# Altium schematic sheet HUB75Ports.SchDoc
size A3; SheetNumber: 5; SheetTotal: 5
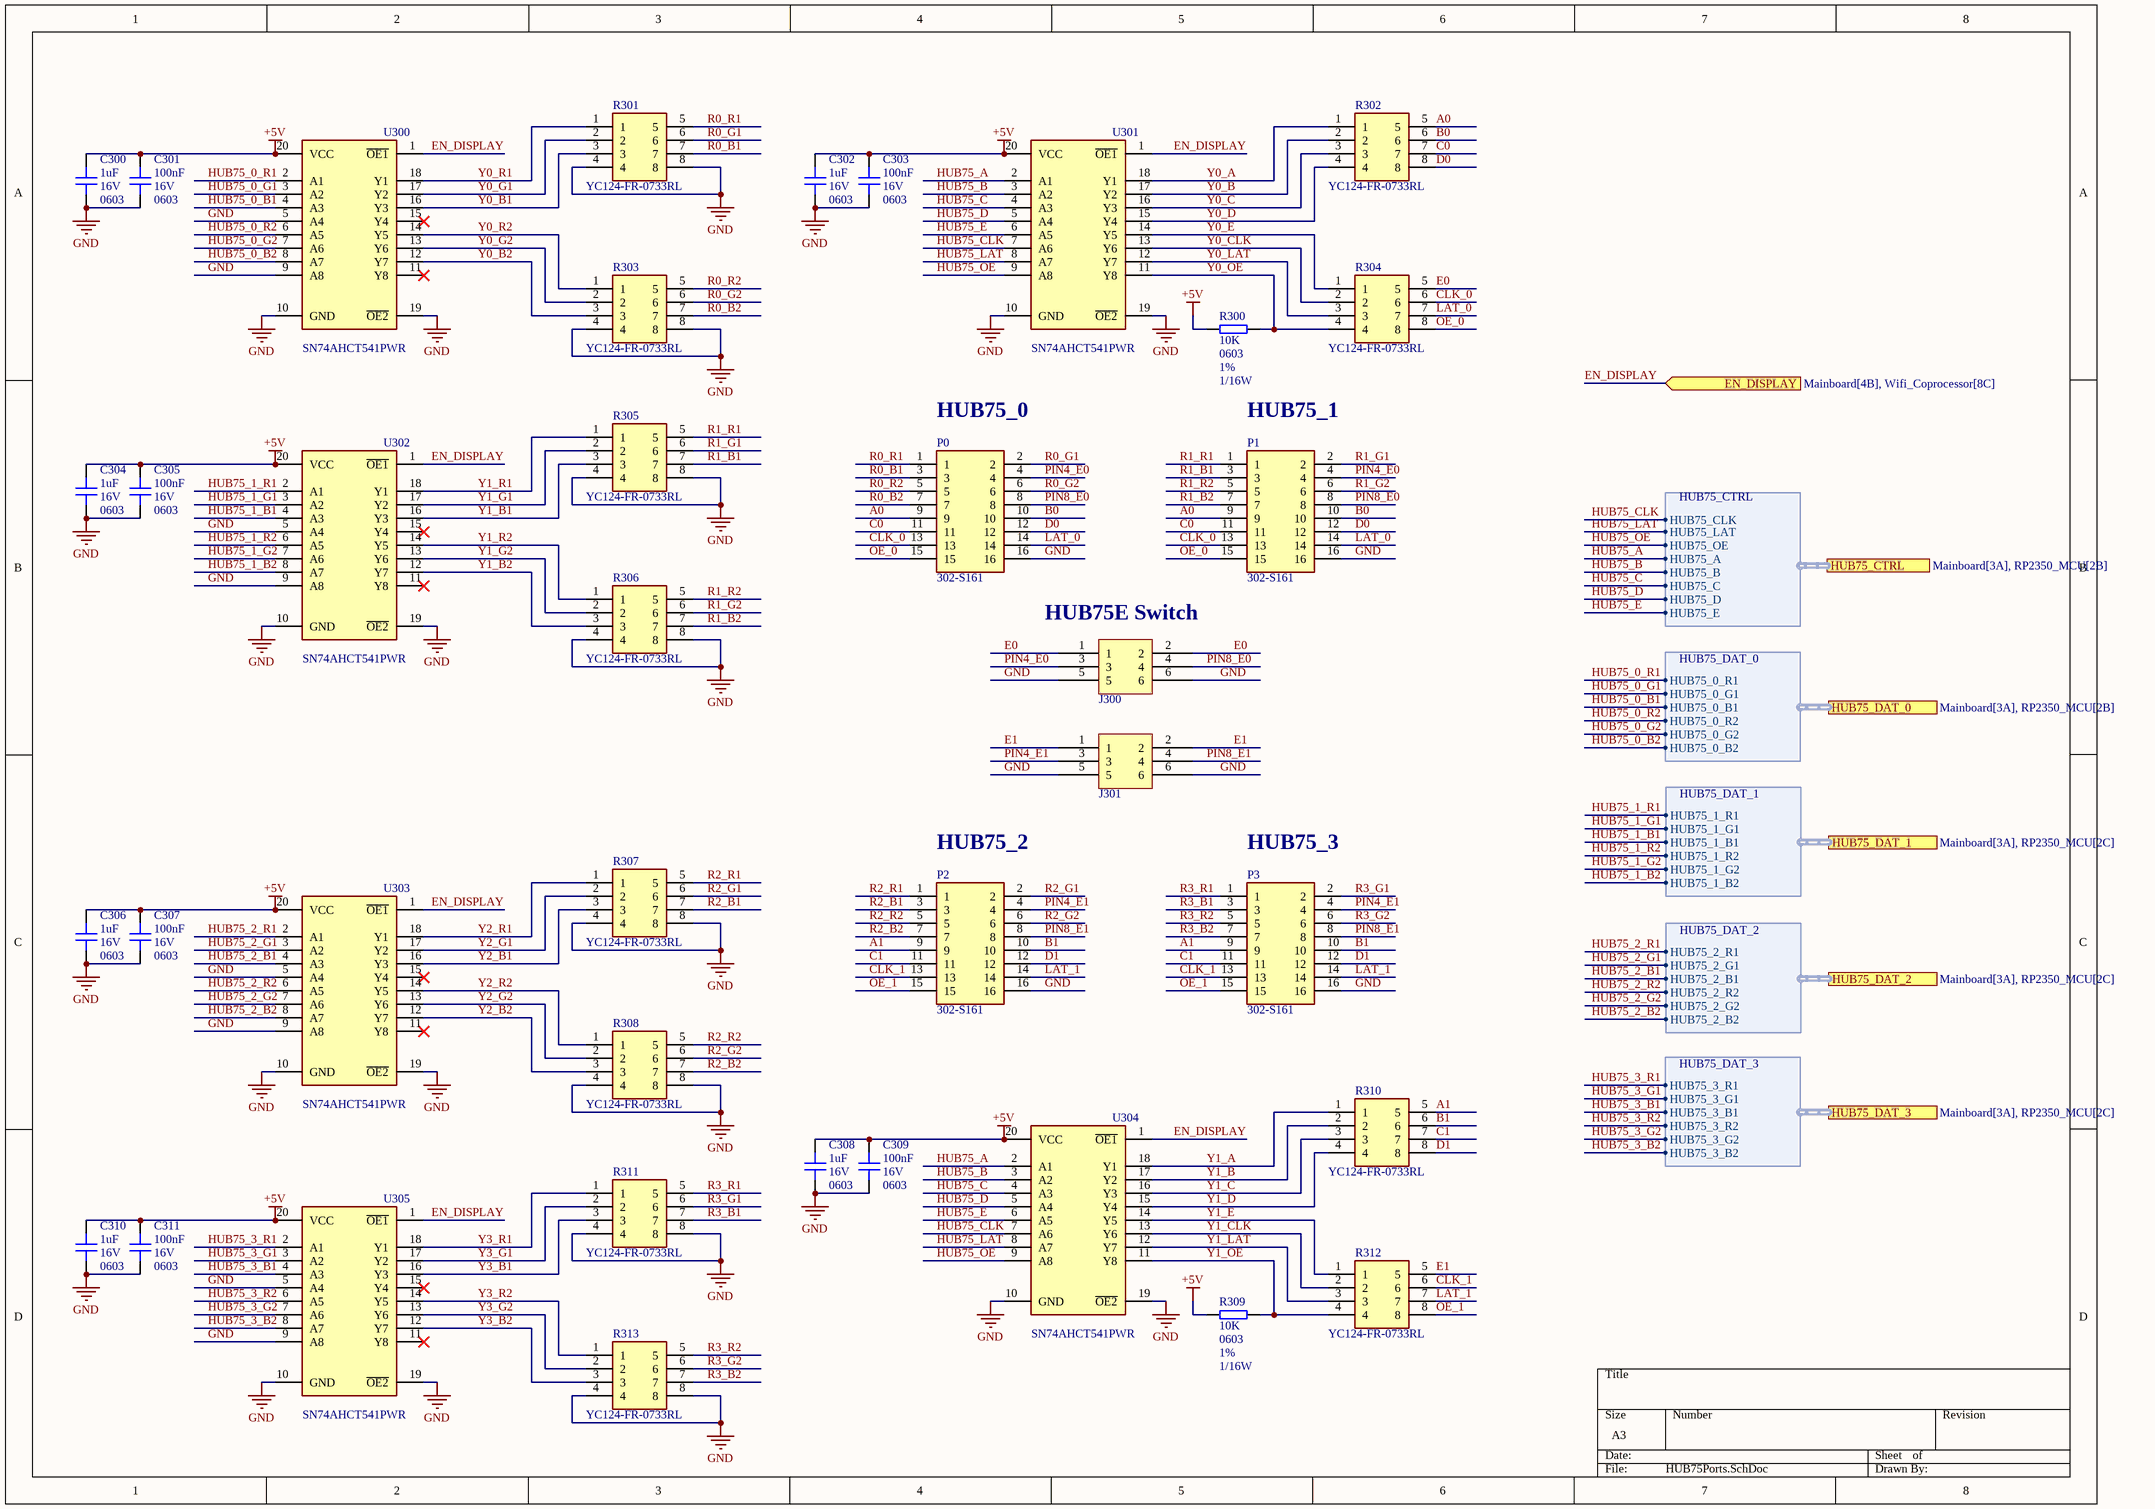
[diagram p0: HUB75Ports.SchDoc]

## Parts
C300  1uF  Voltage: 16V  Package: 0603  [C0603]
C301  100nF  Voltage: 16V  Package: 0603  [C0603]
C302  1uF  Voltage: 16V  Package: 0603  [C0603]
C303  100nF  Voltage: 16V  Package: 0603  [C0603]
C304  1uF  Voltage: 16V  Package: 0603  [C0603]
C305  100nF  Voltage: 16V  Package: 0603  [C0603]
C306  1uF  Voltage: 16V  Package: 0603  [C0603]
C307  100nF  Voltage: 16V  Package: 0603  [C0603]
C308  1uF  Voltage: 16V  Package: 0603  [C0603]
C309  100nF  Voltage: 16V  Package: 0603  [C0603]
C310  1uF  Voltage: 16V  Package: 0603  [C0603]
C311  100nF  Voltage: 16V  Package: 0603  [C0603]
J300  ZX-PZ2.54-2-3PZZ  [HDR-TH_6P-P2.54-V-M-R2-C3-S2.54-1]  (value not drawn)
J301  ZX-PZ2.54-2-3PZZ  [HDR-TH_6P-P2.54-V-M-R2-C3-S2.54-1]  (value not drawn)
P0  302-S161  [SHDR16W66P254_2X8_2792X905X905P]
P1  302-S161  [SHDR16W66P254_2X8_2792X905X905P]
P2  302-S161  [SHDR16W66P254_2X8_2792X905X905P]
P3  302-S161  [SHDR16W66P254_2X8_2792X905X905P]
R300  10K  Package: 0603  Tolerence: 1%  Power: 1/16W  [R0603_1608]
R301  YC124-FR-0733RL  [YC124FR0733RL]
R302  YC124-FR-0733RL  [YC124FR0733RL]
R303  YC124-FR-0733RL  [YC124FR0733RL]
R304  YC124-FR-0733RL  [YC124FR0733RL]
R305  YC124-FR-0733RL  [YC124FR0733RL]
R306  YC124-FR-0733RL  [YC124FR0733RL]
R307  YC124-FR-0733RL  [YC124FR0733RL]
R308  YC124-FR-0733RL  [YC124FR0733RL]
R309  10K  Package: 0603  Tolerence: 1%  Power: 1/16W  [R0603_1608]
R310  YC124-FR-0733RL  [YC124FR0733RL]
R311  YC124-FR-0733RL  [YC124FR0733RL]
R312  YC124-FR-0733RL  [YC124FR0733RL]
R313  YC124-FR-0733RL  [YC124FR0733RL]
U300  SN74AHCT541PWR  [SOP65P640X120-20N]
U301  SN74AHCT541PWR  [SOP65P640X120-20N]
U302  SN74AHCT541PWR  [SOP65P640X120-20N]
U303  SN74AHCT541PWR  [SOP65P640X120-20N]
U304  SN74AHCT541PWR  [SOP65P640X120-20N]
U305  SN74AHCT541PWR  [SOP65P640X120-20N]

## Ports
EN_DISPLAY (in, see Mainboard[4B], Wifi_Coprocessor[8C]), HUB75_CTRL (harness HUB75_CTRL, see Mainboard[3A], RP2350_MCU[2B]), HUB75_DAT_0 (harness HUB75_DAT_0, see Mainboard[3A], RP2350_MCU[2B]), HUB75_DAT_1 (harness HUB75_DAT_1, see Mainboard[3A], RP2350_MCU[2C]), HUB75_DAT_2 (harness HUB75_DAT_2, see Mainboard[3A], RP2350_MCU[2C]), HUB75_DAT_3 (harness HUB75_DAT_3, see Mainboard[3A], RP2350_MCU[2C])

## Harnesses
HUB75_CTRL: HUB75_CLK, HUB75_LAT, HUB75_OE, HUB75_A, HUB75_B, HUB75_C, HUB75_D, HUB75_E
HUB75_DAT_0: HUB75_0_R1, HUB75_0_G1, HUB75_0_B1, HUB75_0_R2, HUB75_0_G2, HUB75_0_B2
HUB75_DAT_1: HUB75_1_R1, HUB75_1_G1, HUB75_1_B1, HUB75_1_R2, HUB75_1_G2, HUB75_1_B2
HUB75_DAT_2: HUB75_2_R1, HUB75_2_G1, HUB75_2_B1, HUB75_2_R2, HUB75_2_G2, HUB75_2_B2
HUB75_DAT_3: HUB75_3_R1, HUB75_3_G1, HUB75_3_B1, HUB75_3_R2, HUB75_3_G2, HUB75_3_B2

## Nets
+5V: C300.2 C301.2 C302.2 C303.2 C304.2 C305.2 C306.2 C307.2 C308.2 C309.2 C310.2 C311.2 R300.2 R309.2 U300.20(VCC) U301.20(VCC) U302.20(VCC) U303.20(VCC) U304.20(VCC) U305.20(VCC)
GND: C300.1 C301.1 C302.1 C303.1 C304.1 C305.1 C306.1 C307.1 C308.1 C309.1 C310.1 C311.1 J300.5 J300.6 J301.5 J301.6 P0.16 P1.16 P2.16 P3.16 R301.4 R301.8 R303.4 R303.8 R305.4 R305.8 R306.4 R306.8 R307.4 R307.8 R308.4 R308.8 R311.4 R311.8 R313.4 R313.8 U300.5(A4) U300.9(A8) U300.10(GND) U300.19(~{OE2}) U301.10(GND) U301.19(~{OE2}) U302.5(A4) U302.9(A8) U302.10(GND) U302.19(~{OE2}) U303.5(A4) U303.9(A8) U303.10(GND) U303.19(~{OE2}) U304.10(GND) U304.19(~{OE2}) U305.5(A4) U305.9(A8) U305.10(GND) U305.19(~{OE2})
A0: P0.9 P1.9 R302.5
A1: P2.9 P3.9 R310.5
B0: P0.10 P1.10 R302.6
B1: P2.10 P3.10 R310.6
C0: P0.11 P1.11 R302.7
C1: P2.11 P3.11 R310.7
CLK_0: P0.13 P1.13 R304.6
CLK_1: P2.13 P3.13 R312.6
D0: P0.12 P1.12 R302.8
D1: P2.12 P3.12 R310.8
E0: J300.1 J300.2 R304.5
E1: J301.1 J301.2 R312.5
EN_DISPLAY: U300.1(~{OE1}) U301.1(~{OE1}) U302.1(~{OE1}) U303.1(~{OE1}) U304.1(~{OE1}) U305.1(~{OE1}) ; port EN_DISPLAY
HUB75_0_B1: U300.4(A3) ; port HUB75_DAT_0.HUB75_0_B1
HUB75_0_B2: U300.8(A7) ; port HUB75_DAT_0.HUB75_0_B2
HUB75_0_G1: U300.3(A2) ; port HUB75_DAT_0.HUB75_0_G1
HUB75_0_G2: U300.7(A6) ; port HUB75_DAT_0.HUB75_0_G2
HUB75_0_R1: U300.2(A1) ; port HUB75_DAT_0.HUB75_0_R1
HUB75_0_R2: U300.6(A5) ; port HUB75_DAT_0.HUB75_0_R2
HUB75_1_B1: U302.4(A3) ; port HUB75_DAT_1.HUB75_1_B1
HUB75_1_B2: U302.8(A7) ; port HUB75_DAT_1.HUB75_1_B2
HUB75_1_G1: U302.3(A2) ; port HUB75_DAT_1.HUB75_1_G1
HUB75_1_G2: U302.7(A6) ; port HUB75_DAT_1.HUB75_1_G2
HUB75_1_R1: U302.2(A1) ; port HUB75_DAT_1.HUB75_1_R1
HUB75_1_R2: U302.6(A5) ; port HUB75_DAT_1.HUB75_1_R2
HUB75_2_B1: U303.4(A3) ; port HUB75_DAT_2.HUB75_2_B1
HUB75_2_B2: U303.8(A7) ; port HUB75_DAT_2.HUB75_2_B2
HUB75_2_G1: U303.3(A2) ; port HUB75_DAT_2.HUB75_2_G1
HUB75_2_G2: U303.7(A6) ; port HUB75_DAT_2.HUB75_2_G2
HUB75_2_R1: U303.2(A1) ; port HUB75_DAT_2.HUB75_2_R1
HUB75_2_R2: U303.6(A5) ; port HUB75_DAT_2.HUB75_2_R2
HUB75_3_B1: U305.4(A3) ; port HUB75_DAT_3.HUB75_3_B1
HUB75_3_B2: U305.8(A7) ; port HUB75_DAT_3.HUB75_3_B2
HUB75_3_G1: U305.3(A2) ; port HUB75_DAT_3.HUB75_3_G1
HUB75_3_G2: U305.7(A6) ; port HUB75_DAT_3.HUB75_3_G2
HUB75_3_R1: U305.2(A1) ; port HUB75_DAT_3.HUB75_3_R1
HUB75_3_R2: U305.6(A5) ; port HUB75_DAT_3.HUB75_3_R2
HUB75_A: U301.2(A1) U304.2(A1) ; port HUB75_CTRL.HUB75_A
HUB75_B: U301.3(A2) U304.3(A2) ; port HUB75_CTRL.HUB75_B
HUB75_C: U301.4(A3) U304.4(A3) ; port HUB75_CTRL.HUB75_C
HUB75_CLK: U301.7(A6) U304.7(A6) ; port HUB75_CTRL.HUB75_CLK
HUB75_D: U301.5(A4) U304.5(A4) ; port HUB75_CTRL.HUB75_D
HUB75_E: U301.6(A5) U304.6(A5) ; port HUB75_CTRL.HUB75_E
HUB75_LAT: U301.8(A7) U304.8(A7) ; port HUB75_CTRL.HUB75_LAT
HUB75_OE: U301.9(A8) U304.9(A8) ; port HUB75_CTRL.HUB75_OE
LAT_0: P0.14 P1.14 R304.7
LAT_1: P2.14 P3.14 R312.7
OE_0: P0.15 P1.15 R304.8
OE_1: P2.15 P3.15 R312.8
PIN4_E0: J300.3 P0.4 P1.4
PIN4_E1: J301.3 P2.4 P3.4
PIN8_E0: J300.4 P0.8 P1.8
PIN8_E1: J301.4 P2.8 P3.8
R0_B1: P0.3 R301.7
R0_B2: P0.7 R303.7
R0_G1: P0.2 R301.6
R0_G2: P0.6 R303.6
R0_R1: P0.1 R301.5
R0_R2: P0.5 R303.5
R1_B1: P1.3 R305.7
R1_B2: P1.7 R306.7
R1_G1: P1.2 R305.6
R1_G2: P1.6 R306.6
R1_R1: P1.1 R305.5
R1_R2: P1.5 R306.5
R2_B1: P2.3 R307.7
R2_B2: P2.7 R308.7
R2_G1: P2.2 R307.6
R2_G2: P2.6 R308.6
R2_R1: P2.1 R307.5
R2_R2: P2.5 R308.5
R3_B1: P3.3 R311.7
R3_B2: P3.7 R313.7
R3_G1: P3.2 R311.6
R3_G2: P3.6 R313.6
R3_R1: P3.1 R311.5
R3_R2: P3.5 R313.5
Y0_A: R302.1 U301.18(Y1)
Y0_B: R302.2 U301.17(Y2)
Y0_B1: R301.3 U300.16(Y3)
Y0_B2: R303.3 U300.12(Y7)
Y0_C: R302.3 U301.16(Y3)
Y0_CLK: R304.2 U301.13(Y6)
Y0_D: R302.4 U301.15(Y4)
Y0_E: R304.1 U301.14(Y5)
Y0_G1: R301.2 U300.17(Y2)
Y0_G2: R303.2 U300.13(Y6)
Y0_LAT: R304.3 U301.12(Y7)
Y0_OE: R300.1 R304.4 U301.11(Y8)
Y0_R1: R301.1 U300.18(Y1)
Y0_R2: R303.1 U300.14(Y5)
Y1_A: R310.1 U304.18(Y1)
Y1_B: R310.2 U304.17(Y2)
Y1_B1: R305.3 U302.16(Y3)
Y1_B2: R306.3 U302.12(Y7)
Y1_C: R310.3 U304.16(Y3)
Y1_CLK: R312.2 U304.13(Y6)
Y1_D: R310.4 U304.15(Y4)
Y1_E: R312.1 U304.14(Y5)
Y1_G1: R305.2 U302.17(Y2)
Y1_G2: R306.2 U302.13(Y6)
Y1_LAT: R312.3 U304.12(Y7)
Y1_OE: R309.1 R312.4 U304.11(Y8)
Y1_R1: R305.1 U302.18(Y1)
Y1_R2: R306.1 U302.14(Y5)
Y2_B1: R307.3 U303.16(Y3)
Y2_B2: R308.3 U303.12(Y7)
Y2_G1: R307.2 U303.17(Y2)
Y2_G2: R308.2 U303.13(Y6)
Y2_R1: R307.1 U303.18(Y1)
Y2_R2: R308.1 U303.14(Y5)
Y3_B1: R311.3 U305.16(Y3)
Y3_B2: R313.3 U305.12(Y7)
Y3_G1: R311.2 U305.17(Y2)
Y3_G2: R313.2 U305.13(Y6)
Y3_R1: R311.1 U305.18(Y1)
Y3_R2: R313.1 U305.14(Y5)

Not connected (* = marked no-connect by the designer): U300 11(Y8)* 15(Y4)*; U302 11(Y8)* 15(Y4)*; U303 11(Y8)* 15(Y4)*; U305 11(Y8)* 15(Y4)*

## Notes on the sheet
- (near P0) HUB75_0
- (near P1) HUB75_1
- (near J300) HUB75E Switch
- (near P2) HUB75_2
- (near P3) HUB75_3

## Library data of the parts
C300 C302 C304 C306 C308 C310 = CAP_0603_16V: SMD Capacitor; Tolerance: 10%; Temperature Coefficient: X7R; Designator: ?; Value: 1uF; Dielectric: ?; Manufacturer Reference: ?; Power: ?; Excepted: ?
C301 C303 C305 C307 C309 C311 = CAP_0603_16V: SMD Capacitor; Designator: ?; Value: 100nF; Dielectric: ?; Manufacturer Reference: ?; Tolerance: ?; Power: ?; Excepted: ?
J300 J301 = ZX-PZ2.54-2-3PZZ: Manufacturer: Megastar(兆星); Add into BOM: yes; Pin Structure: 2x3P; Pitch: 2.54mm; Circluar Pins/Square Pins: Pin Header; Current Rating: 3A; Voltage Rating (Max): 1kV; Symbol: ZX-PZ2.54-2-3PZZ; Device: ZX-PZ2.54-2-3PZZ; LCSC Part Name: 2x3P 间距:2.54mm 方针 直插; Supplier Part: C7501274; Manufacturer Part: ZX-PZ2.54-2-3PZZ; Supplier Footprint: 插件,P=2.54mm; JLCPCB Part Class: Extended Part; Datasheet: https://item.szlcsc.com/datasheet/ZX-PZ2.54-2-3PZZ/8582487.html; Supplier: LCSC; Convert to PCB: yes; Row Spacing: 2.54mm; Mounting Type: Through Hole; Number of Rows: 2; Number of Pins: 6P; Length of Mating Pin: 6mm; Insulation Height: 2.5mm; Length of End Connection Pin: 3mm; Contact Material: Brass; Contact Plating: Gold; Operating Temperature: -40℃~+105℃; Color: Black; Designator: ?; Dielectric: ?; Excepted: ?; Package: ?; Power: ?; Tolerance: ?; Value: ?; Voltage: ?
P0-P3 = 302-S161: 2.54mm Dual Row, Vertical Box Header; Manufacturer_Name: On Shore Technology Inc.; Geometry.Height: 9.05mm; Manufacturer_Part_Number: 302-S161; Mouser Part Number: *; Mouser Price/Stock: *; Arrow Part Number: 302-S161; Arrow Price/Stock: null?region=nac; Datasheet Link: http://www.on-shore.com/wp-content/uploads/2018/04/302-SXX1.pdf
R300 R309 = Resistor: SMD Resistor; Designator: ?; Value: 10K; Voltage: ?; Dielectric: ?; Manufacturer Reference: ?; Excepted: ?
R301-R308 R310-R313 = YC124-FR-0733RL: 33 Ohm +/-1% 62.5mW Power Per Element Isolated 4 Resistor Network/Array +/-200ppm/C 0804, Convex, Long Side Terminals; Manufacturer_Name: Yageo Group; Geometry.Height: 0.55mm; Manufacturer_Part_Number: YC124-FR-0733RL; Mouser Part Number: 603-YC124-FR-0733RL; Mouser Price/Stock: https://www.mouser.co.uk/ProductDetail/YAGEO/YC124-FR-0733RL?qs=Omyi%252BwOkBJUSdM%252BPj18Bfg%3D%3D; Arrow Part Number: YC124-FR-0733RL; Arrow Price/Stock: https://www.arrow.com/en/products/yc124-fr-0733rl/yageo.html?utm_currency=USD&region=nac; Datasheet Link: https://yageogroup.com/content/datasheet/asset/file/PYU-YC_TC_GROUP_51_ROHS_L
U300-U305 = SN74AHCT541PWR: Octal Buffers/Drivers With 3-State Outputs; Manufacturer_Name: Texas Instruments; Geometry.Height: 1.2mm; Manufacturer_Part_Number: SN74AHCT541PWR; Mouser Part Number: 595-SN74AHCT541PWR; Mouser Price/Stock: https://www.mouser.co.uk/ProductDetail/Texas-Instruments/SN74AHCT541PWR?qs=L4Mc90zKIphKuQtt%252Bo5snQ%3D%3D; Arrow Part Number: SN74AHCT541PWR; Arrow Price/Stock: https://www.arrow.com/en/products/sn74ahct541pwr/texas-instruments.html?utm_currency=USD&region=nac; Datasheet Link: http://www.ti.com/lit/gpn/sn74ahct541